# Altium schematic sheet Power_Section.SchDoc
size A4; DocumentNumber: 2; SheetNumber: 2; SheetTotal: 8
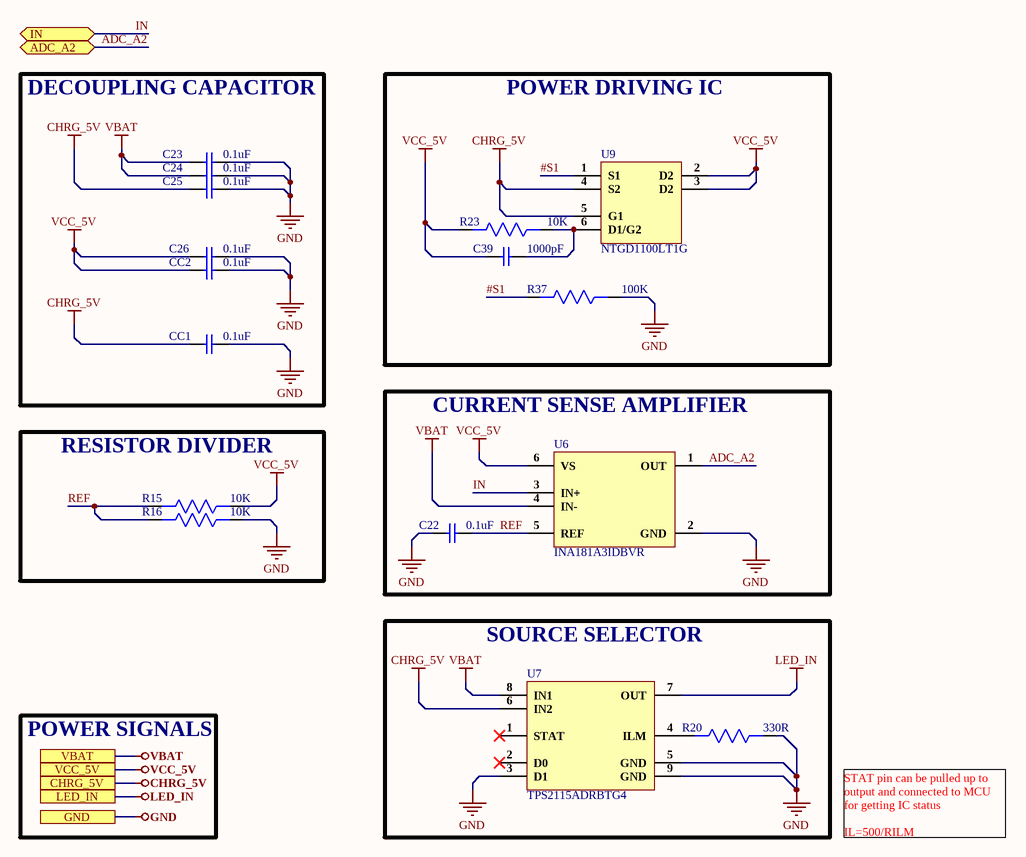
[diagram p0: Power_Section.SchDoc]

## Parts
C22  0.1uF  [Cap0603]
C23  0.1uF  [Cap0603]
C24  0.1uF  [Cap0603]
C25  0.1uF  [Cap0603]
C26  0.1uF  [Cap0603]
C39  1000pF  [Cap0603]
CC1  0.1uF  [Cap0603]
CC2  0.1uF  [Cap0603]
R15  10K  [Res0603]
R16  10K  [Res0603]
R20  330R  [Res0603]
R23  10K  [Res0603]
R37  100K  [Res0603]
U6  INA181A3IDBVR  [INA181A3IDBVR]
U7  TPS2115ADRBTG4  [TPS2115ADRBTG4]
U9  NTGD1100LT1G  [NTGD1100LT1G]

## Blocks framed on the sheet
DECOUPLING CAPACITOR: C23-C26 CC1 CC2
POWER DRIVING IC: C39 R23 R37 U9
CURRENT SENSE AMPLIFIER: C22 U6
RESISTOR DIVIDER: R15 R16
SOURCE SELECTOR: R20 U7

## Ports
ADC_A2 (bidir), CHRG_5V, GND, IN (bidir), LED_IN, VBAT, VCC_5V

## Nets
CHRG_5V: C25.1 CC1.1 U7.6(IN2) U9.4(S2) U9.5(G1) ; port CHRG_5V
GND: C22.2 C23.2 C24.2 C25.2 C26.1 CC1.2 CC2.2 R16.1 R20.1 R37.1 U6.2(GND) U7.3(D1) U7.5(GND) U7.9(GND) ; port GND
LED_IN: U7.7(OUT) ; port LED_IN
VBAT: C23.1 C24.1 U6.4(IN-) U7.8(IN1) ; port VBAT
VCC_5V: C26.2 C39.1 CC2.1 R15.1 R23.2 U6.6(VS) U9.2(D2) U9.3(D2) ; port VCC_5V
#S1: R37.2 U9.1(S1)
ADC_A2: U6.1(OUT) ; port ADC_A2
IN: U6.3(IN+) ; port IN
REF: C22.1 R15.2 R16.2 U6.5(REF)
NetC39_2: C39.2 R23.1 U9.6(D1/G2)
NetR20_2: R20.2 U7.4(ILM)

Not connected (* = marked no-connect by the designer): U7 1(STAT)* 2(D0)*

## Notes on the sheet
- POWER SIGNALS
- STAT pin can be pulled up to output and connected to MCU for getting IC status
  IL=500/RILM

## Library data of the parts
C22-C26 CC1 CC2 = CC0603ZRY5V9BB104: CAP CER 0.1UF 50V Y5V 0603; Manufacturer: Yageo; Capacitance: 100nF; Tolerance: 80%; Supplier 1: Digi-Key; Manufacturer Part Number: CC0603ZRY5V9BB104; Stock 1: 15000880; Pricing 1: 1=0.1, 10=0.075, 100=0.0334, 500=0.02386, 1000=0.01874 (USD); Mount: Surface Mount; Case/Package: 0603; Number of Pins: 2; Case Code (Metric): 1608; Case Code (Imperial): 0603; Min Operating Temperature: -30°C; Max Operating Temperature: 85°C; Dielectric: Y5V; Voltage Rating: 50V; Package Quantity: 1; Packaging: Tape and Reel; Voltage Rating (DC): 50V; Termination: SMD/SMT; Composition: Ceramic; Voltage: 50V; Length: 1.6mm; Height: 0.8mm; Width: 0.031inch; Thickness: 0.035inch; Depth: 0.8mm; Radiation Hardening: No; REACH SVHC: No SVHC; Lead Free: Lead Free; Halogen Free: Halogen Free; ComponentLink1URL: http://www.yageo.com/documents/recent/UPY-GPHC_Y5V_6.3V-to-50V_8.pdf?src-supplier=Digi-Key; ComponentLink1Description: http://www.yageo.com/documents/recent/UPY-GPHC_Y5V_6.3V-to-50V_8.pdf?src-supplier=Digi-Key; ComponentLink2URL: http://www.yageo.com/documents/recent/UPY-GPHC_Y5V_6.3V-to-50V_5.pdf?src-supplier=Avnet+Europe; ComponentLink2Description: http://www.yageo.com/documents/recent/UPY-GPHC_Y5V_6.3V-to-50V_5.pdf?src-supplier=Avnet+Europe; ComponentLink3URL: https://www.verical.com/server-webapp/html/getDatasheet?partID=403611&src-supplier=Verical; ComponentLink3Description: https://www.verical.com/server-webapp/html/getDatasheet?partID=403611&src-supplier=Verical; ComponentLink4URL: http://www.mouser.com/ds/2/447/Yageo_UPY-GP_NP0_16V-to-50V_9-358835.pdf?src-supplier=Mouser; ComponentLink4Description: http://www.mouser.com/ds/2/447/Yageo_UPY-GP_NP0_16V-to-50V_9-358835.pdf?src-supplier=Mouser; ComponentLink5URL: http://www.farnell.com/datasheets/1132289.pdf?src-supplier=Element14; ComponentLink5Description: http://www.farnell.com/datasheets/1132289.pdf?src-supplier=Element14; Supplier Part Number 1: 311-1343-1-ND
C39 = 0603ZC102KAT2A: CAP CER 1000PF 10V X7R 0603; Manufacturer: Kyocera AVX; Capacitance: 1nF; Tolerance: 10%; Dissipation Factor: 5%; Supplier 1: Digi-Key; Manufacturer Part Number: 0603ZC102KAT2A; RoHS: Yes; Category: Ceramic Capacitors; Stock 1: 43409; Pricing 1: 1=0.10000, 10=0.05400, 50=0.02960, 100=0.02420, 500=0.01730, 1000=0.01360 (USD); Mount: Surface Mount; Case/Package: 0603; Number of Pins: 2; Case Code (Metric): 1608; Case Code (Imperial): 0603; Min Operating Temperature: -55°C; Max Operating Temperature: 125°C; Dielectric: X7R; Packaging: Tape and Reel; Voltage Rating: 10V; Package Quantity: 4000; Voltage Rating (DC): 10V; Termination: SMD/SMT; Series: -; Construction: Flat; Length: 1.6mm; Width: 0.032inch; Depth: 0.81mm; Thickness: 0.035inch; Radiation Hardening: No; REACH SVHC: Unknown; Lead Free: Lead Free; RoHS Compliant: Yes; ComponentLink1URL: https://datasheet.ciiva.com/204/cx7r-204553.pdf?src-supplier=Digi-Key; ComponentLink1Description: https://datasheet.ciiva.com/204/cx7r-204553.pdf?src-supplier=Digi-Key; ComponentLink2URL: https://datasheet.ciiva.com/5411/cx7r-218113-5411035.pdf?src-supplier=Mouser; ComponentLink2Description: https://datasheet.ciiva.com/5411/cx7r-218113-5411035.pdf?src-supplier=Mouser; Supplier Part Number 1: 478-0603ZC102KAT2ACT-ND
R15 R16 R23 = AC0603JR-0710KL: RES SMD 10K OHM 5% 1/10W 0603; Manufacturer: Yageo; Voltage Rating: 50V; Resistance: 10kR; Power Rating: 100mW; Temperature Coefficient: 100ppm/°C; Supplier 1: Future Electronics; Manufacturer Part Number: AC0603JR-0710KL; RoHS: Yes; Category: Chip SMD Resistors; Stock 1: 1533000; Pricing 1: 5000=0.00540 (USD); Case/Package: 0603; Case Code (Imperial): 0603; Case Code (Metric): 1608; Size Code: 0603; Min Operating Temperature: -55°C; Max Operating Temperature: 155°C; Packaging: Tape and Reel; Tolerance: 5%; Package Quantity: 1; Resistor Type: Thick Film; Termination: SMD/SMT; Number of Terminations: 2; Max Power Dissipation: 100mW; Features: Moisture Resistant,Automotive AEC-Q200,Anti-Sulfur; Series: AC; Construction: Rectangular; Length: 0.063inch; Width: 0.031inch; Height: 0.022inch; Depth: 0.8mm; Military Standard: Not; Lead Free: Lead Free; RoHS Compliant: Yes; ComponentLink1URL: https://datasheet.ciiva.com/5562/pyu-ac-51-rohs-l-2-5562553.pdf?src-supplier=Mouser; ComponentLink1Description: https://datasheet.ciiva.com/5562/pyu-ac-51-rohs-l-2-5562553.pdf?src-supplier=Mouser; Supplier Part Number 1: 1029044
R20 = ERJU3RD3300V: RES SMD 0.5% 100mW 33kΩ 0603; Manufacturer: PANASONIC; Temperature Coefficient: ±50ppm/℃; Tolerance: ±0.5%; Power(Watts): 100mW; Operating Temperature Range: -55℃~+155℃
R37 = RC0603FR-07100KL: RES SMD 100K OHM 1% 1/10W 0603
U6 = INA181A3IDBVR: 26V, bi-directional, 350kHz current sense amplifier 6-SOT-23 -40 to 125; Manufacturer: Texas Instruments; Number of Circuits: 1; Slew Rate: 2V/µs; Operating Supply Current: 260uA; FET Type: 2 N-Channel; Drain to Source Voltage (Vdss): 60V; Rds On Max: 2.1mR; Input Capacitance: 4.84nF; Max Power Dissipation: 12W; Supplier 1: Digi-Key; Manufacturer Part Number: INA181A3IDBVR; RoHS: Yes; Category: Amplifiers - Op Amps, Buffer, Instrumentation; Stock 1: 3258; Pricing 1: 1=0.51000, 10=0.43700, 25=0.40800, 100=0.32650, 250=0.30316, 500=0.25652, 1000=0.19822 (USD); Mount: Surface Mount; Case/Package: SOT-23-6; Number of Pins: 22; Min Operating Temperature: -40°C; Max Operating Temperature: 125°C; Packaging: Cut Tape; -3db Bandwidth: 350kHz; RoHS Compliant: Yes; ComponentLink1URL: http://www.ti.com/lit/ds/symlink/ina181.pdf?src-supplier=Digi-Key; ComponentLink1Description: http://www.ti.com/lit/ds/symlink/ina181.pdf?src-supplier=Digi-Key; Supplier Part Number 1: 296-47658-1-ND
U7 = TPS2115ADRBTG4: Autoswitching Power Mux 8-SON -40 to 85; Manufacturer: Texas Instruments; Operating Supply Voltage: 5.5V; Number of Outputs: 1; Number of Inputs: 2; Output Current: 1.25A; Min Input Voltage: 2.8V; Turn-On Delay Time: 1ms; Supplier 1: Digi-Key; Manufacturer Part Number: TPS2115ADRBTG4; RoHS: Yes; Category: Integrated Circuits (ICs); Pricing 1: 500=1.58974 (USD); Case/Package: VSON; Number of Pins: 8; Weight: 0.000847oz; Min Operating Temperature: -40°C; Max Operating Temperature: 85°C; Package Quantity: 250; Packaging: Tape and Reel; Max Output Current: 1.25A; Max Input Voltage: 5.5V; Current - Output 2: 1.25A; Series: -; Radiation Hardening: No; Lead Free: Lead Free; RoHS Compliant: Yes; ComponentLink1URL: https://datasheet.ciiva.com/15109/getdatasheetpartid-681241-15109323.pdf?src-supplier=Verical; ComponentLink1Description: https://datasheet.ciiva.com/15109/getdatasheetpartid-681241-15109323.pdf?src-supplier=Verical; ComponentLink2URL: https://datasheet.ciiva.com/3232/tps2115a-3232539.pdf?src-supplier=Avnet; ComponentLink2Description: https://datasheet.ciiva.com/3232/tps2115a-3232539.pdf?src-supplier=Avnet; ComponentLink3URL: https://datasheet.ciiva.com/1961/tps2115a-1961014.pdf?src-supplier=Digi-Key; ComponentLink3Description: https://datasheet.ciiva.com/1961/tps2115a-1961014.pdf?src-supplier=Digi-Key; Supplier Part Number 1: TPS2115ADRBTG4-ND
U9 = NTGD1100LT1G: IC PWR DRIVER P-CHAN 1:1 6TSOP; Manufacturer: onsemi; Manufacturer Part No:: NTGD1100LT1G; Package: Custom; ComponentLink1Description: New link; ComponentLink1URL: https://www.digikey.co.uk/en/products/detail/onsemi/NTGD1100LT1G/1484846